# Altium schematic sheet [10] - DOC REVISION HISTORY.SchDoc
size A2; DocumentNumber: 3; SheetNumber: 10; SheetTotal: 10
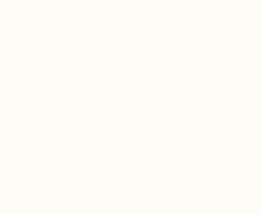
[diagram p0: [10] - DOC REVISION HISTORY.SchDoc, left]
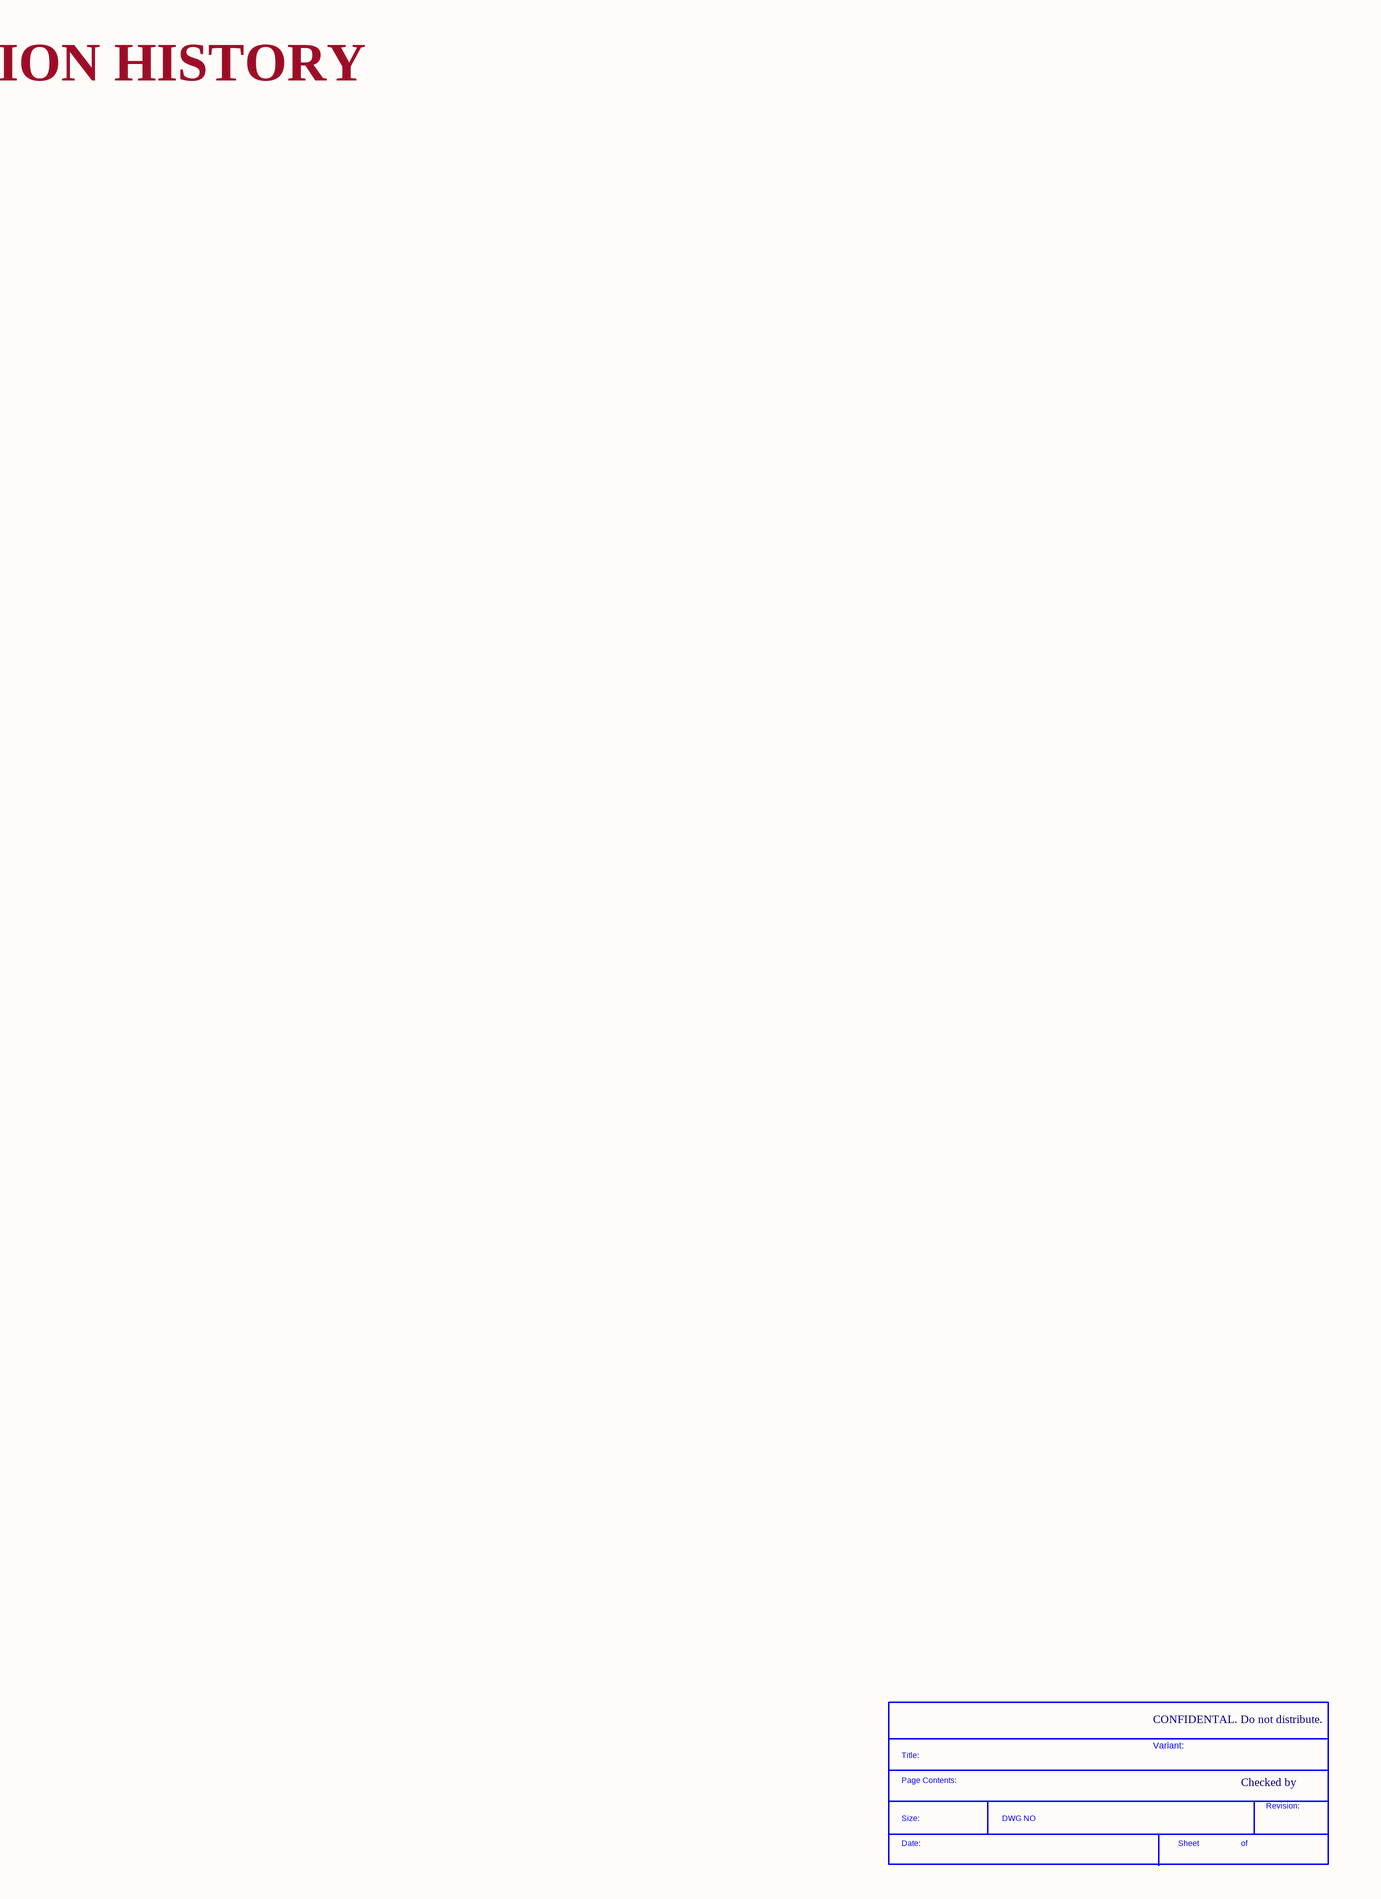
[diagram p1: [10] - DOC REVISION HISTORY.SchDoc, right]

## Parts
*  SDTitleBlock  (value not drawn)  (graphical)

## Notes on the sheet
- DOC: REVISION HISTORY
- CONFIDENTAL. Do not distribute.
- CLOCKS (CPU & PCIE)
- Variant:
- Checked by
- (in symbol SDTitleBlock) Title:; Page Contents:; Revision:; Size:; DWG NO; Date:; Sheet; of